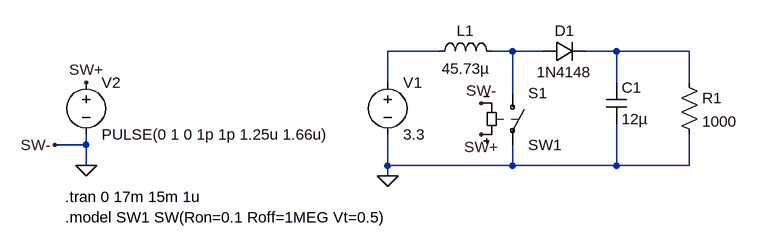
[diagram p0: schematic SteadyState_1.asc]
SteadyState_1.asc, the LTspice schematic file:
Version 4.1
SHEET 1 880 680
WIRE 96 80 16 80
WIRE 208 80 176 80
WIRE 256 80 208 80
WIRE 368 80 320 80
WIRE 480 80 368 80
WIRE 16 128 16 80
WIRE 368 128 368 80
WIRE 480 128 480 80
WIRE 208 144 208 80
WIRE -448 224 -448 208
WIRE -448 224 -496 224
WIRE -448 256 -448 224
WIRE 16 256 16 208
WIRE 208 256 208 224
WIRE 208 256 16 256
WIRE 368 256 368 192
WIRE 368 256 208 256
WIRE 480 256 480 208
WIRE 480 256 368 256
WIRE 16 272 16 256
FLAG 160 208 SW+
FLAG 160 160 SW-
FLAG -448 128 SW+
FLAG -496 224 SW-
FLAG -448 256 0
FLAG 16 272 0
SYMBOL voltage 16 112 R0
WINDOW 123 0 0 Left 0
WINDOW 39 0 0 Left 0
SYMATTR InstName V1
SYMATTR Value 3.3
SYMBOL ind 80 96 R270
WINDOW 0 32 56 VTop 2
WINDOW 3 5 56 VBottom 2
SYMATTR InstName L1
SYMATTR Value 45.73µ
SYMBOL diode 256 96 R270
WINDOW 0 32 32 VTop 2
WINDOW 3 0 32 VBottom 2
SYMATTR InstName D1
SYMATTR Value 1N4148
SYMBOL cap 352 128 R0
SYMATTR InstName C1
SYMATTR Value 12µ
SYMBOL res 464 112 R0
SYMATTR InstName R1
SYMATTR Value 1000
SYMBOL sw 208 128 R0
SYMATTR InstName S1
SYMATTR Value SW1
SYMBOL voltage -448 112 R0
WINDOW 123 0 0 Left 0
WINDOW 39 0 0 Left 0
SYMATTR InstName V2
SYMATTR Value PULSE(0 1 0 1p 1p 1.25u 1.66u)
TEXT -480 304 Left 2 !.tran 0 17m 15m 1u
TEXT -480 336 Left 2 !.model SW1 SW(Ron=0.1 Roff=1MEG Vt=0.5)

The netlist it stands for:
* SteadyState_1.asc
V1 N001 0 3.3
L1 N001 N002 45.73µ
D1 N002 N003 1N4148
C1 N003 0 12µ
R1 N003 0 1000
S1 N002 0 SW+ 0 SW1
V2 SW+ 0 PULSE(0 1 0 1p 1p 1.25u 1.66u)
.model D D
.lib standard.dio
.tran 0 17m 15m 1u
.model SW1 SW(Ron=0.1 Roff=1MEG Vt=0.5)
.backanno
.end